# Altium schematic sheet measure_dev.SchDoc
size A2; SheetNumber: 1; SheetTotal: 9
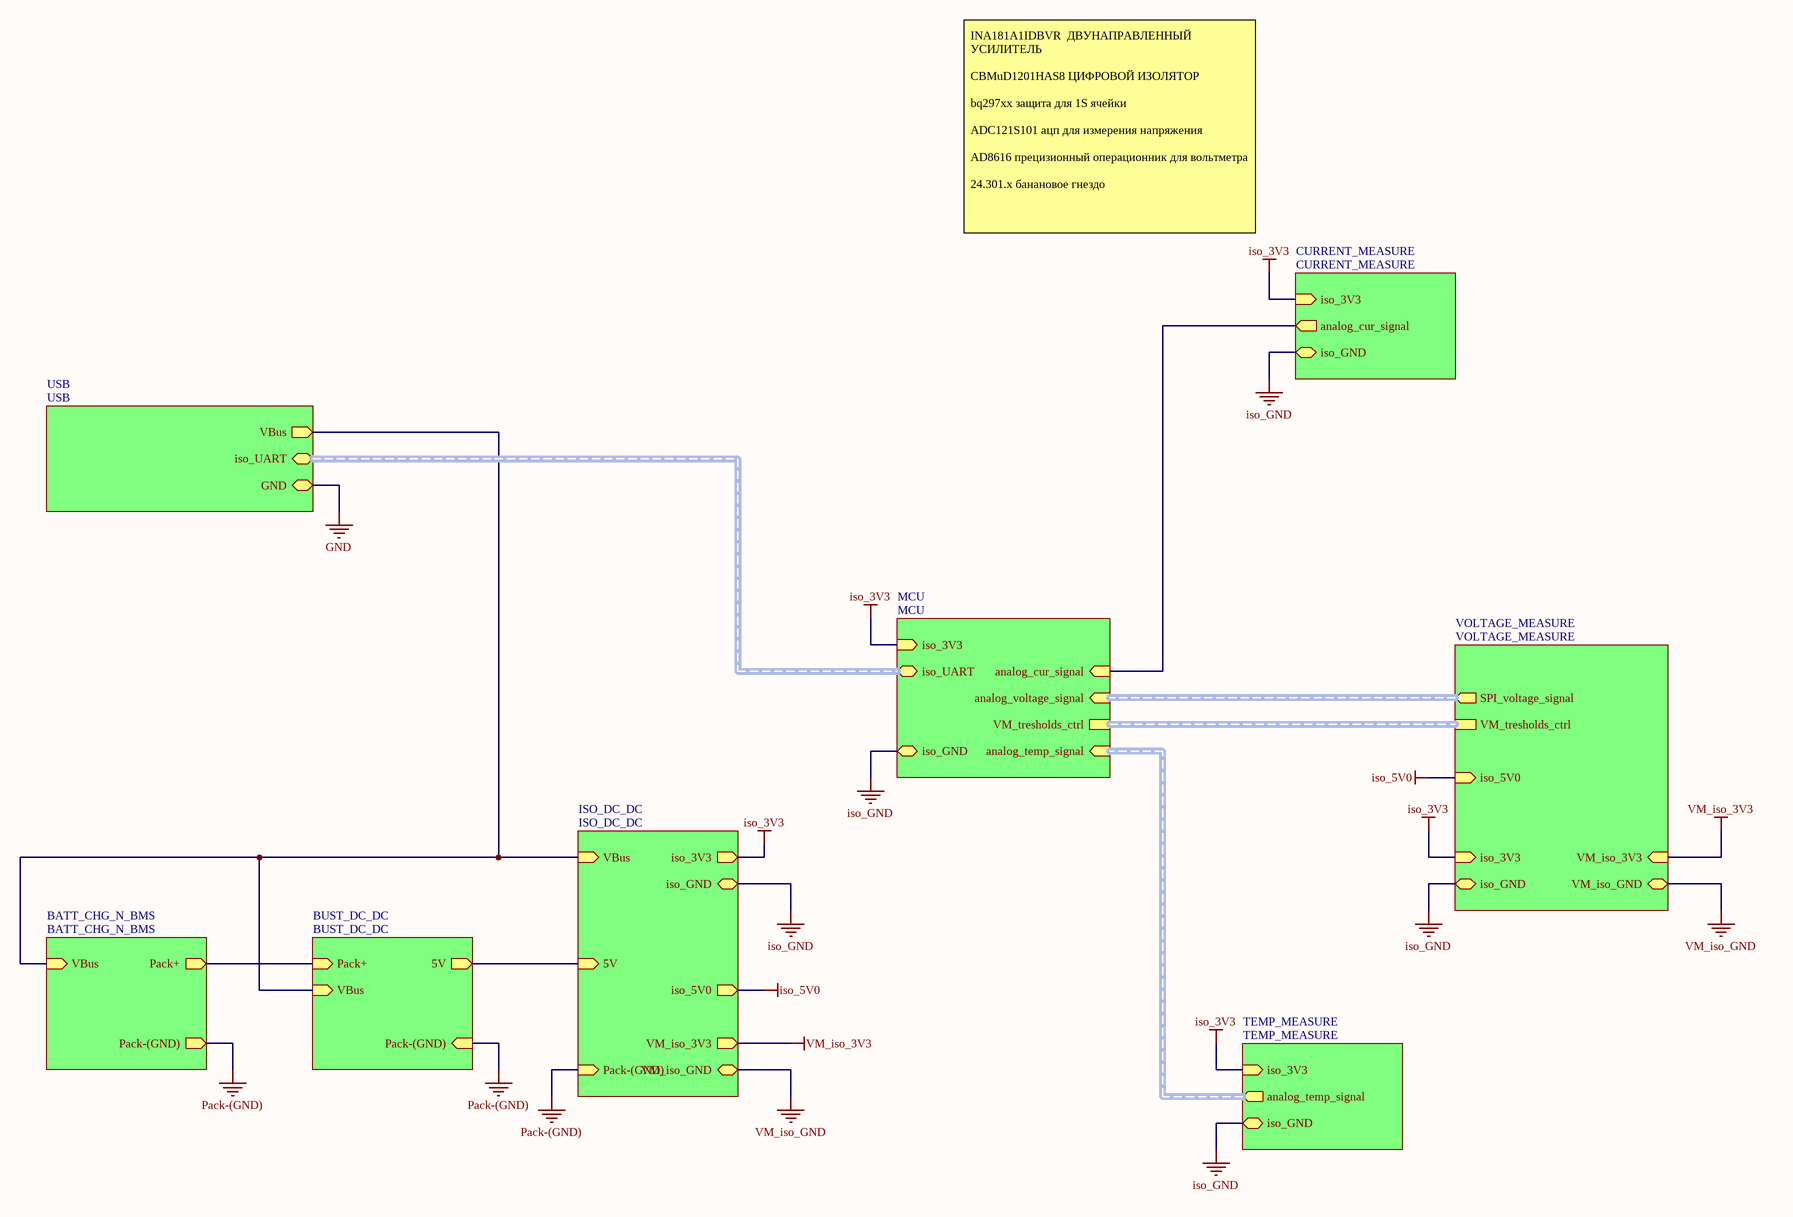
[diagram p0: measure_dev.SchDoc]

## Sub-sheets
BATT_CHG_N_BMS = BATT_CHG_N_BMS: VBus (in), Pack+ (out), Pack-(GND) (out)
BUST_DC_DC = BUST_DC_DC: Pack+ (in), 5V (out), Pack-(GND) (in), VBus (in)
CURRENT_MEASURE = CURRENT_MEASURE: iso_3V3 (in), iso_GND (bidir), analog_cur_signal (out)
ISO_DC_DC = ISO_DC_DC: VBus (in), 5V (in), iso_3V3 (out), iso_GND (bidir), VM_iso_3V3 (out), VM_iso_GND (bidir), Pack-(GND) (in), iso_5V0 (out)
MCU = MCU: iso_3V3 (in), iso_GND (bidir), analog_cur_signal (in), iso_UART (bidir), analog_voltage_signal (in), analog_temp_signal (in), VM_tresholds_ctrl
TEMP_MEASURE = TEMP_MEASURE: analog_temp_signal (out), iso_GND (bidir), iso_3V3 (in)
USB = USB: VBus (out), iso_UART (bidir), GND (bidir)
VOLTAGE_MEASURE = VOLTAGE_MEASURE: SPI_voltage_signal (out), iso_GND (bidir), iso_3V3 (in), VM_iso_3V3 (in), VM_iso_GND (bidir), VM_tresholds_ctrl, iso_5V0 (in)

## Nets
GND: sheet USB/GND
iso_3V3: sheet CURRENT_MEASURE/iso_3V3, sheet MCU/iso_3V3, sheet ISO_DC_DC/iso_3V3, sheet VOLTAGE_MEASURE/iso_3V3, sheet TEMP_MEASURE/iso_3V3
iso_5V0: sheet ISO_DC_DC/iso_5V0, sheet VOLTAGE_MEASURE/iso_5V0
iso_GND: sheet CURRENT_MEASURE/iso_GND, sheet MCU/iso_GND, sheet ISO_DC_DC/iso_GND, sheet VOLTAGE_MEASURE/iso_GND, sheet TEMP_MEASURE/iso_GND
Pack-(GND): sheet ISO_DC_DC/Pack-(GND), sheet BATT_CHG_N_BMS/Pack-(GND), sheet BUST_DC_DC/Pack-(GND)
VM_iso_3V3: sheet ISO_DC_DC/VM_iso_3V3, sheet VOLTAGE_MEASURE/VM_iso_3V3
VM_iso_GND: sheet ISO_DC_DC/VM_iso_GND, sheet VOLTAGE_MEASURE/VM_iso_GND
(unnamed): sheet CURRENT_MEASURE/analog_cur_signal, sheet MCU/analog_cur_signal
(unnamed): sheet USB/VBus, sheet ISO_DC_DC/VBus, sheet BATT_CHG_N_BMS/VBus, sheet BUST_DC_DC/VBus
(unnamed): sheet ISO_DC_DC/5V, sheet BUST_DC_DC/5V
(unnamed): sheet BATT_CHG_N_BMS/Pack+, sheet BUST_DC_DC/Pack+

## Buses and harness runs
harness sheet MCU/analog_temp_signal = sheet TEMP_MEASURE/analog_temp_signal
harness sheet MCU/analog_voltage_signal = sheet VOLTAGE_MEASURE/SPI_voltage_signal
harness sheet MCU/iso_UART = sheet USB/iso_UART
harness sheet MCU/VM_tresholds_ctrl = sheet VOLTAGE_MEASURE/VM_tresholds_ctrl

## Notes on the sheet
- INA181A1IDBVR  ДВУНАПРАВЛЕННЫЙ УСИЛИТЕЛЬ
  CBMuD1201HAS8 ЦИФРОВОЙ ИЗОЛЯТОР
  bq297xx защита для 1S ячейки
  ADC121S101 ацп для измерения напряжения
  AD8616 прецизионный операционник для вольтметра
  24.301.x банановое гнездо